# Altium schematic sheet Transform_310_3_24_24.SchDoc
size A; SheetNumber: 6; SheetTotal: 9
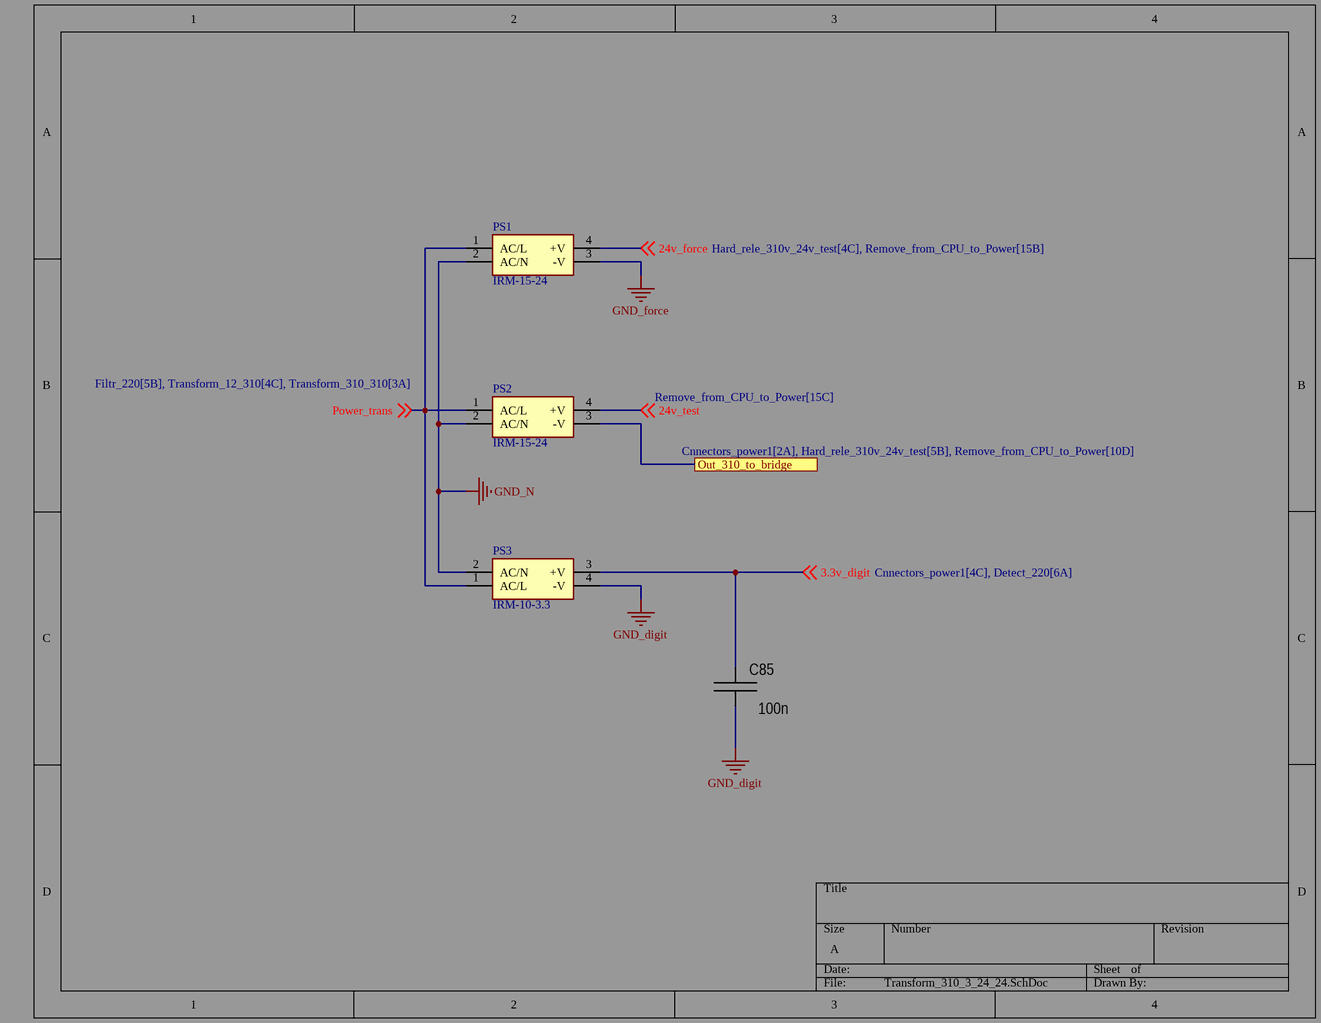
[diagram p0: Transform_310_3_24_24.SchDoc]

## Parts
C85  value 100n  [CAP: 1206]
PS1  IRM-15-24  [IRM-15-5]
PS2  IRM-15-24  [IRM-15-5]
PS3  IRM-10-3.3  [IRM1033]

## Ports
Out_310_to_bridge (see Cnnectors_power1[2A], Hard_rele_310v_24v_test[5B], Remove_from_CPU_to_Power[10D])

## Nets
GND_digit: C85.1 PS3.4(-V)
GND_force: PS1.3(-V)
GND_N: PS1.2(AC/N) PS2.2(AC/N) PS3.2(AC/N)
3.3v_digit: C85.2 PS3.3(+V) ; off-sheet 3.3v_digit
24v_force: PS1.4(+V) ; off-sheet 24v_force
24v_test: PS2.4(+V) ; off-sheet 24v_test
Out_310_to_bridge: PS2.3(-V) ; port Out_310_to_bridge
Power_trans: PS1.1(AC/L) PS2.1(AC/L) PS3.1(AC/L) ; off-sheet Power_trans

## Library data of the parts
C85 = Ceramic_1206: Manufacturer: Yageo; PartNumber: CC1206KRX7R9BB104; ValueManufacturerPartNumber: Ceramic capacitor, 100n, X7R, ±10%, 50V, 1206, -55...+125°C; TypeCapacitor: Ceramic capacitor; Tolerance: ±10%; TypeDielectric: X7R; Voltage: 50V; Package: 1206; HelpURL: https://www.digikey.com/product-detail/en/yageo/CC1206KRX7R9BB104/311-1179-1-ND/303089; Temperature: -55...+125°C
PS1 PS2 = IRM-15-24: Power Supply; Manufacturer_Name: Mean Well; Datasheet Link: https://componentsearchengine.com/Datasheets/2/IRM-15-24.pdf; Manufacturer_Part_Number: IRM-15-24; Mouser Part Number: 709-IRM15-24; Mouser Price/Stock: https://www.mouser.co.uk/ProductDetail/MEAN-WELL/IRM-15-24?qs=WkdRfq4wf1PZSEWhZtKDbQ%3D%3D; Arrow Part Number: IRM-15-24; Arrow Price/Stock: https://www.arrow.com/en/products/irm-15-24/mean-well-enterprises?utm_currency=USD&region=europe
PS3 = IRM-10-3.3: Power Supply; Manufacturer_Name: Mean Well; Datasheet Link: https://datasheet.datasheetarchive.com/originals/distributors/DKDS-14/277831.pdf; Height: 21.5mm; Manufacturer_Part_Number: IRM-10-3.3; Mouser Part Number: 709-IRM10-3.3; Mouser Price/Stock: https://www.mouser.co.uk/ProductDetail/MEAN-WELL/IRM-10-3.3?qs=WkdRfq4wf1M%252Ba4IjD903Hw%3D%3D; Arrow Part Number: IRM-10-3.3; Arrow Price/Stock: https://www.arrow.com/en/products/irm-10-3.3/mean-well-enterprises?region=nac